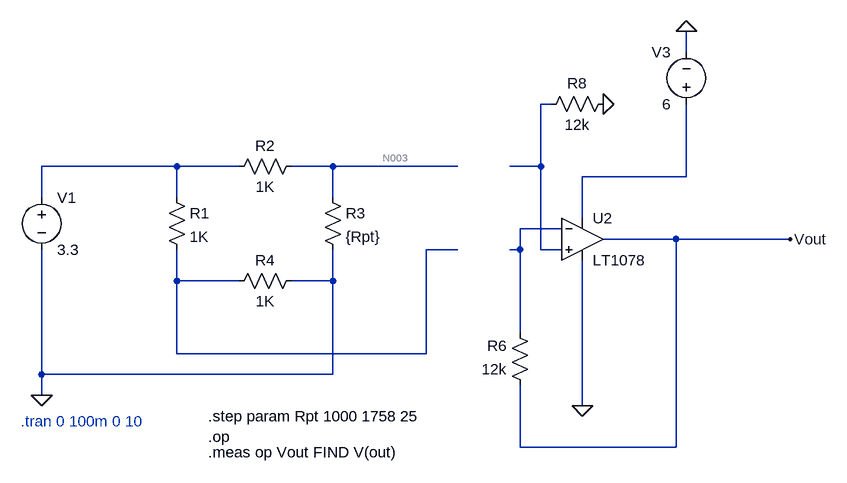
[diagram p0: schematic wheatstone bridge.asc]
wheatstone bridge.asc, the LTspice schematic file:
Version 4.1
SHEET 1 1240 680
WIRE 1008 -48 1008 -80
WIRE 800 32 784 32
WIRE 224 128 16 128
WIRE 320 128 224 128
WIRE 464 128 400 128
WIRE 656 128 464 128
WIRE 784 128 784 32
WIRE 784 128 736 128
WIRE 1008 144 1008 32
WIRE 1008 144 848 144
WIRE 16 176 16 128
WIRE 224 176 224 128
WIRE 464 176 464 128
WIRE 848 208 848 144
WIRE 816 224 752 224
WIRE 992 240 880 240
WIRE 1168 240 992 240
WIRE 656 256 608 256
WIRE 752 256 752 224
WIRE 752 256 736 256
WIRE 784 256 784 128
WIRE 816 256 784 256
WIRE 224 304 224 256
WIRE 320 304 224 304
WIRE 464 304 464 256
WIRE 464 304 400 304
WIRE 752 384 752 256
WIRE 224 416 224 304
WIRE 608 416 608 256
WIRE 608 416 224 416
WIRE 16 448 16 256
WIRE 464 448 464 304
WIRE 464 448 16 448
WIRE 16 480 16 448
WIRE 848 496 848 272
WIRE 752 560 752 464
WIRE 992 560 992 240
WIRE 992 560 752 560
FLAG 848 496 0
FLAG 16 480 0
FLAG 1008 -80 0
FLAG 1168 240 Vout
FLAG 880 32 0
SYMBOL voltage 16 160 R0
SYMATTR InstName V1
SYMATTR Value 3.3
SYMBOL res 208 160 R0
SYMATTR InstName R1
SYMATTR Value 1K
SYMBOL res 448 160 R0
SYMATTR InstName R3
SYMATTR Value {Rpt}
SYMBOL res 416 112 R90
WINDOW 0 0 56 VBottom 2
WINDOW 3 32 56 VTop 2
SYMATTR InstName R2
SYMATTR Value 1K
SYMBOL res 416 288 R90
WINDOW 0 0 56 VBottom 2
WINDOW 3 32 56 VTop 2
SYMATTR InstName R4
SYMATTR Value 1K
SYMBOL res 768 480 R180
WINDOW 0 36 76 Left 2
WINDOW 3 36 40 Left 2
SYMATTR InstName R6
SYMATTR Value 12k
SYMBOL res 896 16 R90
WINDOW 0 0 56 VBottom 2
WINDOW 3 32 56 VTop 2
SYMATTR InstName R8
SYMATTR Value 12k
SYMBOL voltage 1008 48 R180
WINDOW 0 24 96 Left 2
WINDOW 3 24 16 Left 2
SYMATTR InstName V3
SYMATTR Value 6
SYMBOL OpAmps\\LT1078 848 176 R0
SYMATTR InstName U2
TEXT -16 520 Left 2 ;.tran 0 100m 0 10
TEXT 272 512 Left 2 !.step param Rpt 1000 1758 25
TEXT 272 568 Left 2 !.meas op Vout FIND V(out)
TEXT 272 544 Left 2 !.op

The netlist it stands for:
* wheatstone bridge.asc
V1 N002 0 3.3
R1 N002 N006 1K
R3 N003 0 {Rpt}
R2 N003 N002 1K
R4 0 N006 1K
R6 Vout N005 12k
R8 0 N001 12k
V3 N004 0 6
X§U2 N001 N005 N004 0 Vout LT1078  ; pins In+ In- V+ V- OUT
* .tran 0 100m 0 10
.step param Rpt 1000 1758 25
.meas op Vout FIND V(out)
.op
.backanno
.end

* Results of the author's LTspice run, read from the files saved beside the schematic
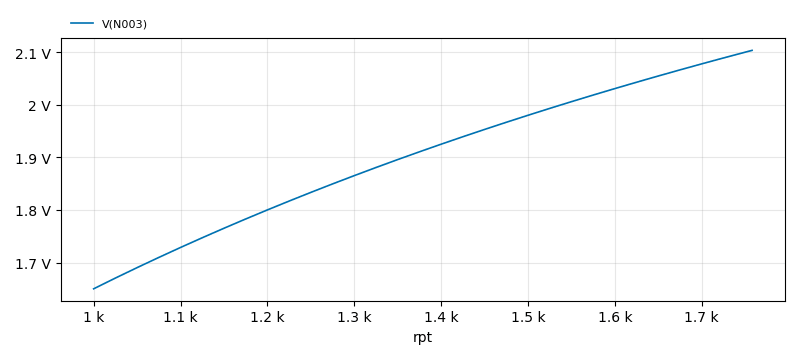
[diagram p1: Operating Point of wheatstone bridge.asc, plotted from the saved traces]
* Operating Point, 1 run:
*   V(N003): 1.65 V at rpt=1 k, 2.103 V at rpt=1.758 k, min 1.65 V, max 2.103 V